# Altium schematic sheet JTAG.SchDoc: TE0720 JTAG connector and reset
size A4; DocumentNumber: ADC-SCH-17; SheetNumber: 17; SheetTotal: 20
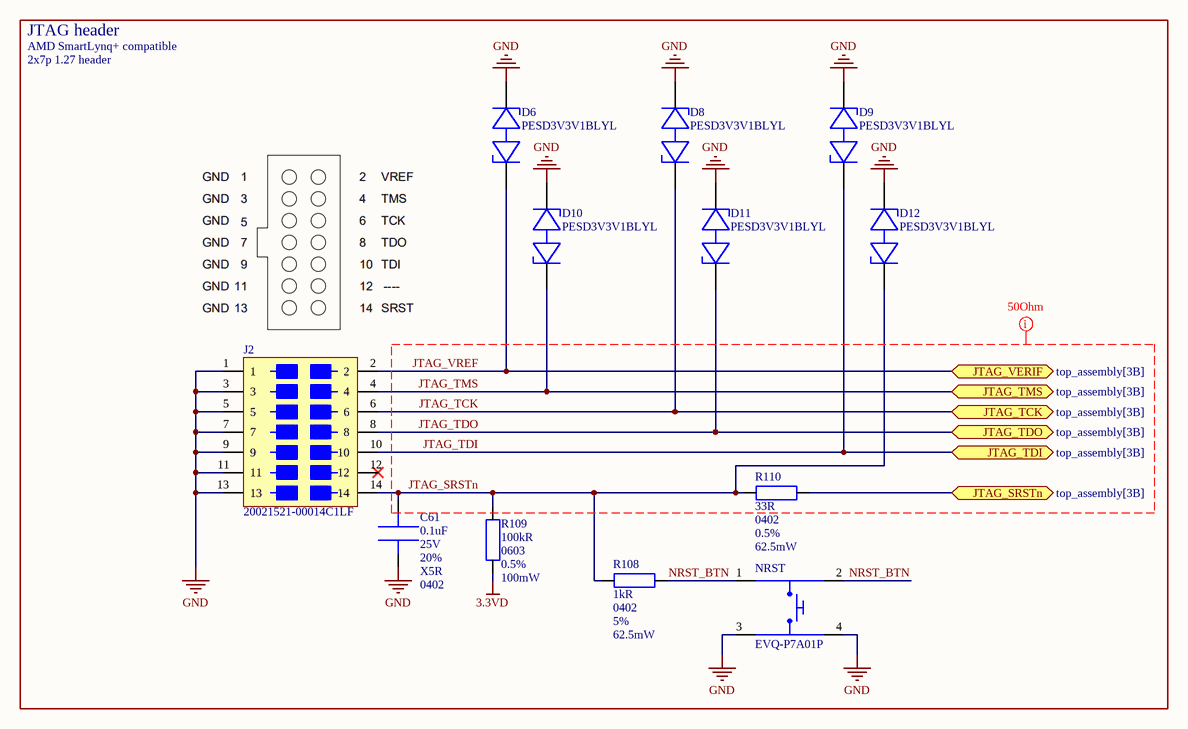
[diagram p0: JTAG.SchDoc]

## Parts
C61  value 0.1uF  Voltage: 25V  Tolerance: 20%  Dielectric: X5R  Package: 0402  [CAPC_0402]  (hidden comment: MSAST105SB5104MFNA01)
D6  PESD3V3V1BLYL  [DIOC_DFN-1006-2]
D8  PESD3V3V1BLYL  [DIOC_DFN-1006-2]
D9  PESD3V3V1BLYL  [DIOC_DFN-1006-2]
D10  PESD3V3V1BLYL  [DIOC_DFN-1006-2]
D11  PESD3V3V1BLYL  [DIOC_DFN-1006-2]
D12  PESD3V3V1BLYL  [DIOC_DFN-1006-2]
J2  20021521-00014C1LF  [CONS_20021521-00014C1LF]
NRST  EVQ-P7A01P  [SWS_EVQP7A]
R108  value 1kR  Package: 0402  Tolerance: 5%  Power: 62.5mW  [RESC_0402]  (hidden comment: RC0402JR-7D1KL)
R109  value 100kR  Package: 0603  Tolerance: 0.5%  Power: 100mW  [RESC_0603]  (hidden comment: AC0603DR-07100KL)
R110  value 33R  Package: 0402  Tolerance: 0.5%  Power: 62.5mW  [RESC_0402]  (hidden comment: RG1005R-330-D-T10)

## Ports
JTAG_SRSTn (bidir, see top_assembly[3B]), JTAG_TCK (bidir, see top_assembly[3B]), JTAG_TDI (bidir, see top_assembly[3B]), JTAG_TDO (bidir, see top_assembly[3B]), JTAG_TMS (bidir, see top_assembly[3B]), JTAG_VERIF (bidir, see top_assembly[3B])

## Nets
3.3VD: R109.2
GND: C61.2 D6.2 D8.2 D9.2 D10.2 D11.2 D12.2 J2.1 J2.3 J2.5 J2.7 J2.9 J2.11 J2.13 NRST.3 NRST.4
JTAG_SRSTn: C61.1 D12.1 J2.14 R108.1 R109.1 R110.2
JTAG_SRSTn: R110.1 ; port JTAG_SRSTn  [a separate net that carries the same name]
JTAG_TCK: D8.1 J2.6 ; port JTAG_TCK
JTAG_TDI: D9.1 J2.10 ; port JTAG_TDI
JTAG_TDO: D11.1 J2.8 ; port JTAG_TDO
JTAG_TMS: D10.1 J2.4 ; port JTAG_TMS
JTAG_VREF: D6.1 J2.2 ; port JTAG_VERIF
NRST_BTN: NRST.1 NRST.2 R108.2

Not connected (* = marked no-connect by the designer): J2 12*

## Layout directives
net class 50OhmSingle: JTAG_SRSTn, JTAG_TCK, JTAG_TDI, JTAG_TDO, JTAG_TMS, JTAG_VREF

## Notes on the sheet
- JTAG header
- AMD SmartLynq+ compatible
- 2x7p 1.27 header
- Drawn by
- Approved by
- Document type
- Date of issue
- Legal owner
- Title
- Circuit diagram
- File
- AGH Marines
- Document no.
- Revision
- Status
- Sheet
- Size
- Lang.
- /
- A4
- EN

## Library data of the parts
C61 = MSAST105SB5104MFNA01: Multilayer Ceramic Capacitors MLCC - SMD/SMT 25V 0.1uF X5R 0402 20%; Manufacturer: TAIYO YUDEN; Supplier 1: Mouser; Supplier Part Number 1: 963-MSAST105SB5104MF
D6 D8-D12 = PESD3V3V1BLYL: ESD Protection Diodes / TVS Diodes SOD882 3.3V BID ESD PROTECT; Manufacturer: Nexperia; Capacitance: 11pF; Package: DFN-1006-2; Voltage: 3.3V; Supplier 1: Mouser; Supplier Part Number 1: 771-PESD3V3V1BLYL
J2 = 20021521-00014C1LF: Headers & Wire Housings VERTICAL SMT TYPE HEADER; Manufacturer: Amphenol FCI; Supplier 1: Mouser; Supplier Part Number 1: 649-202152100014C1LF
NRST = EVQ-P7A01P: Tactile Switches 3.5x2.9mm Right Ang Light Touch Switch; Manufacturer: Panasonic; Supplier 1: Mouser; Supplier Part Number 1: 667-EVQP7A01P
R108 = RC0402JR-7D1KL: Thick Film Resistors - SMD General Purpose Chip Resistor 0402, 1kOhms, 5%, 1/16W; Manufacturer: YAGEO; Supplier 1: Mouser; Supplier Part Number 1: 603-RC0402JR-7D1KL
R109 = AC0603DR-07100KL: Thick Film Resistors - SMD 100 kOhms 1/10 W 75 V 0.5 % 0603 100 PPM / C - 55 C / + 155 C AEC-Q200; Manufacturer: YAGEO; Supplier 1: Mouser; Supplier Part Number 1: 603-AC0603DR-07100KL
R110 = RG1005R-330-D-T10: Thin Film Resistors - SMD 1/16W 33 Ohms 0.5% 0402 100ppm; Manufacturer: Susumu; Supplier 1: Mouser; Supplier Part Number 1: 754-RG1005R-330DT10